# Altium schematic sheet SD-CARD.SchDoc
size A4; SheetNumber: 7; SheetTotal: 7
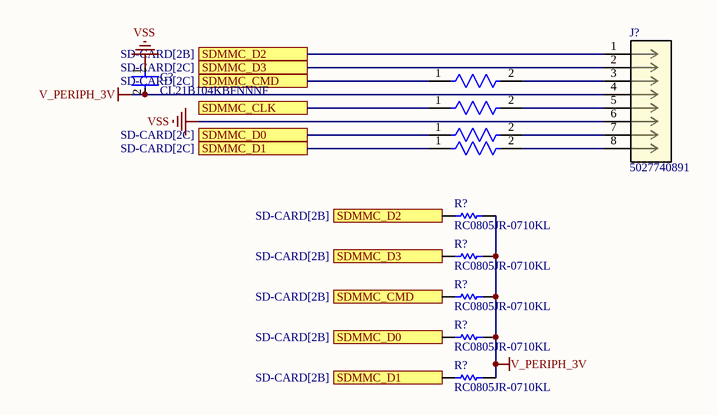
[diagram p0: SD-CARD.SchDoc]

## Parts
(Parts that share a designator on the sheet are numbered #1, #2 ... from top to bottom, then left to right.)
C?  CL21B104KBFNNNF  [FP-CL21-IPC_B]
J?  5027740891  [CONN_502774-0891_MOL]
R?#1  AC0603JR-0722RL  [FP-AC0603-IPC_B]  (value not drawn)
R?#2  AC0603JR-0722RL  [FP-AC0603-IPC_B]  (value not drawn)
R?#3  AC0603JR-0722RL  [FP-AC0603-IPC_B]  (value not drawn)
R?#4  AC0603JR-0722RL  [FP-AC0603-IPC_B]  (value not drawn)
R?#5  RC0805JR-0710KL  [RESC2013X60X35ML10T20]
R?#6  RC0805JR-0710KL  [RESC2013X60X35ML10T20]
R?#7  RC0805JR-0710KL  [RESC2013X60X35ML10T20]
R?#8  RC0805JR-0710KL  [RESC2013X60X35ML10T20]
R?#9  RC0805JR-0710KL  [RESC2013X60X35ML10T20]

## Ports
SDMMC_CLK, SDMMC_CMD (see SD-CARD[2B]), SDMMC_CMD (see SD-CARD[2C]), SDMMC_D0 (see SD-CARD[2B]), SDMMC_D0 (see SD-CARD[2C]), SDMMC_D1 (see SD-CARD[2B]), SDMMC_D1 (see SD-CARD[2C]), SDMMC_D2 (see SD-CARD[2B]), SDMMC_D3 (see SD-CARD[2B]), SDMMC_D3 (see SD-CARD[2C])

## Nets
V_PERIPH_3V: C?.2 J?.4 R?#5.2 R?#6.2 R?#7.2 R?#8.2 R?#9.2
VSS: C?.1 J?.6
SDMMC_CLK: R?#2.1 ; port SDMMC_CLK
SDMMC_CMD: R?#1.1 R?#7.1 ; port SDMMC_CMD
SDMMC_D0: R?#3.1 R?#8.1 ; port SDMMC_D0
SDMMC_D1: R?#4.1 R?#9.1 ; port SDMMC_D1
SDMMC_D2: J?.1 R?#5.1 ; port SDMMC_D2
SDMMC_D3: J?.2 R?#6.1 ; port SDMMC_D3
NetJ?_3: J?.3 R?#1.2
NetJ?_5: J?.5 R?#2.2
NetJ?_7: J?.7 R?#3.2
NetJ?_8: J?.8 R?#4.2

## Library data of the parts
C? = CMP-13271-004652-1: CL21 Series 0805 100nF 50V ±10% Tolerance X7R Multilayer Ceramic Chip Capacitor; Voltage Rating (DC): 50V; Packaging: Tape and Reel; Voltage Rating: 50V; Max Operating Temperature: 125°C; Width: 0.049inch; Thickness: 0.053inch; Dielectric: X7R; Construction: Flat; Series: CL; Radiation Hardening: No; Mount: Surface Mount; Length: 2mm; Contact Plating: Tin; RoHS Compliant: Yes; Case/Package: 0805; Min Operating Temperature: -55°C; Capacitance: 100nF; Tolerance: 10%; Lead Free: Lead Free; Height: 1.25mm; Depth: 1.25mm; Package Quantity: 10000
J? = 5027740891: 1.10mm Pitch microSD Memory Card Connector, Reverse Mount Surface Mount,  Push-Push Type; Manufacturer_Name: Molex Connector Corporation; Type: PC Card Sockets; Copyright: Copyright (C) 2025 Ultra Librarian. All rights reserved.; Manufacturer_Part_Number: 5027740891; RefDes: RefDes
R?#1-R?#4 = CMP-03412-040387-1: RES 22Ω 5.00% 0.1W 0603; Resistance: 22R; Power Rating: 100mW; Temperature Coefficient: 100ppm/°C; Voltage Rating: 50V; Tolerance: 5%; Series: AC; Width: 0.8mm; Termination: SMD/SMT; Case/Package: 0603; Min Operating Temperature: -55°C; Resistor Type: Thick Film; Number of Terminations: 2; Ratings: AEC-Q200; Features: Moisture Resistant; Length: 1.6mm; Packaging: Tape and Reel; Max Power Dissipation: 100mW; Case Code (Imperial): 0603; Height: 0.45mm; Max Operating Temperature: 155°C; Case Code (Metric): 1608
R?#5-R?#9 = CMP-2000-05025-1: Chip Resistor, 10 KOhm, +/- 5%, 0.125 W, -55 to 155 degC, 0805 (2012 Metric), RoHS, Tape and Reel; Manufacturer: Yageo; Resistor Element Type: ThickFilm; Voltage Rating: 150V; Product Range: RCSeries; SVHC: ToBeAdvised; Resistor Case Style: 0805[2012Metric]; Temperature Coefficient: ±100ppm/degC; Power Rating: 250mW; Resistance: 10kohm; Automotive Qualification Standard: -; Datasheet Version: REV. 2, 09/2004; Packaging: CutTape; Resistance Tolerance: ±5%; MSL: MSL1-Unlimited; Manufacturer URL: http://www.yageo.com/; Datasheet URL: http://www.yageo.ru/pdf/RC0805.pdf; Package Description: 2-Pin Surface Mounted Device, Body 2 x 1.25 mm; Package Reference: 805